# Altium schematic sheet Display.SchDoc
size A; SheetNumber: 3; SheetTotal: 5
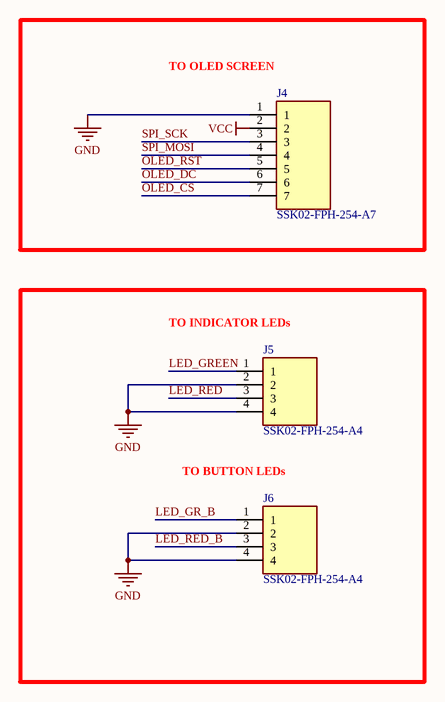
[diagram p0: Display.SchDoc]

## Parts
J4  SSK02-FPH-254-A7  [SAMESKY_SSK02-FPH-254-A7]
J5  SSK02-FPH-254-A4  [SAMESKY_SSK02-FPH-254-A4]
J6  SSK02-FPH-254-A4  [SAMESKY_SSK02-FPH-254-A4]

## Blocks framed on the sheet
TO OLED SCREEN: J4

## Nets
GND: J4.1 J5.2 J5.4 J6.2 J6.4
VCC: J4.2
LED_GR_B: J6.1
LED_GREEN: J5.1
LED_RED: J5.3
LED_RED_B: J6.3
OLED_CS: J4.7
OLED_DC: J4.6
OLED_RST: J4.5
SPI_MOSI: J4.4
SPI_SCK: J4.3

## Notes on the sheet
- (near J5) TO INDICATOR LEDs
- TO BUTTON LEDs

## Library data of the parts
J4 = SSK02-FPH-254-A7: MF: {'manufacturer': u'Same Sky (Formerly CUI Devices)'}; Package: None; Price: None; Value: *; MP: SSK02-FPH-254-A7; Availability: Unavailable
J5 J6 = SSK02-FPH-254-A4: 4 Position Header Connector 0.100 (2.54mm) Through Hole Gold; MF: Same Sky (Formerly CUI Devices); SnapEDA_Link: https://www.snapeda.com/parts/SSK02-FPH-254-A4/Same+Sky/view-part/?ref=snap; Package: None; Value: *; MP: SSK02-FPH-254-A4; Check_prices: https://www.snapeda.com/parts/SSK02-FPH-254-A4/Same+Sky/view-part/?ref=eda